# Altium schematic sheet Touch_Screen_Cont.SchDoc
size A4
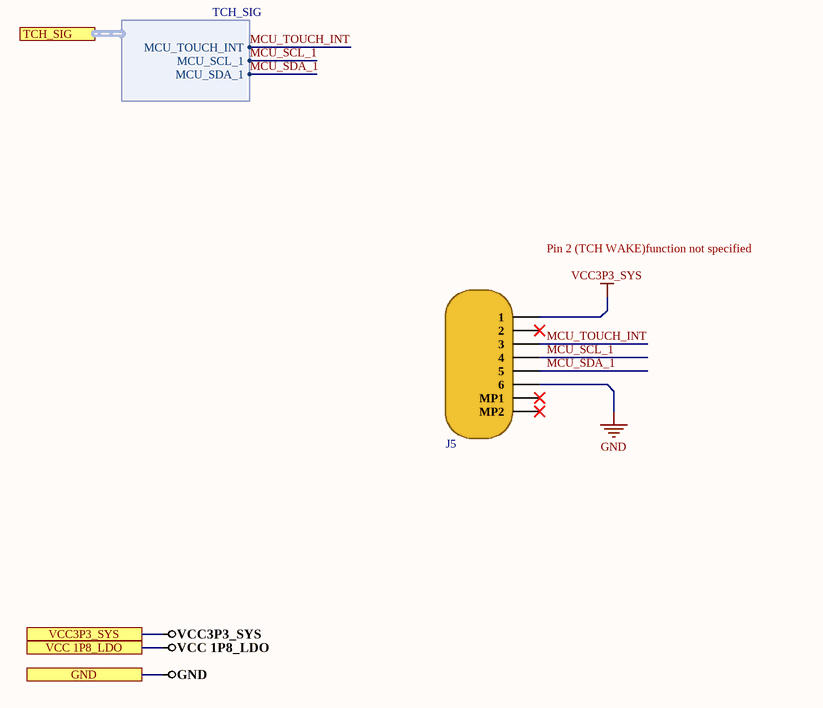
[diagram p0: Touch_Screen_Cont.SchDoc]

## Parts
J5  68710614022  [68710614022]  (value not drawn)

## Ports
GND, TCH_SIG (harness TCH_SIG), VCC3P3_SYS, VCC 1P8_LDO

## Harnesses
TCH_SIG: MCU_TOUCH_INT, MCU_SCL_1, MCU_SDA_1

## Nets
GND: J5.6 ; port GND
VCC3P3_SYS: J5.1 ; port VCC3P3_SYS
VCC 1P8_LDO: port VCC 1P8_LDO
MCU_SCL_1: J5.4 ; port TCH_SIG.MCU_SCL_1
MCU_SDA_1: J5.5 ; port TCH_SIG.MCU_SDA_1
MCU_TOUCH_INT: J5.3 ; port TCH_SIG.MCU_TOUCH_INT

Not connected (* = marked no-connect by the designer): J5 2* MP1* MP2*

## Notes on the sheet
- Pin 2 (TCH WAKE)function not specified

## Library data of the parts
J5 = 68710614022: CONN FPC TOP 6POS 0.50MM R/A; Manufacturer: Wurth Electronics; Actuator Material: Polymer,Liquid Crystal Polymer; Current Rating: 500mA; Voltage Rating: 50V; Number of Positions: 6; Insulation Resistance: 100MR; Gender: Male; Pitch: 0.5mm; Supplier 1: Digi-Key; Manufacturer Part Number: 68710614022; RoHS: Yes; Category: FFC / FPC; Stock 1: 3457; Pricing 1: 1=0.92000, 10=0.88700, 50=0.82600, 100=0.76500, 500=0.70300, 1000=0.64200 (USD); Mount: Surface Mount; Contact Plating: Tin; Contact Material: Bronze,Tin; Housing Material: Liquid Crystal Polymer; Min Operating Temperature: -25°C; Max Operating Temperature: 85°C; Number of Rows: 1; Package Quantity: 1; Packaging: Tape and Reel; Termination: SMD/SMT; Contact Location: Top; Number of Contacts: 6; Orientation: Straight; Length: 9.5mm; Width: 2.1mm; REACH SVHC: Unknown; Flammability Rating: UL94 V-0; ComponentLink1URL: https://datasheet.ciiva.com/25617/0900766b81113bff-25617823.pdf?src-supplier=RSComponents; ComponentLink1Description: https://datasheet.ciiva.com/25617/0900766b81113bff-25617823.pdf?src-supplier=RSComponents; ComponentLink2URL: https://datasheet.ciiva.com/14153/6871xx14022-eng-datasheet-14153909.pdf?src-supplier=Distrelec; ComponentLink2Description: https://datasheet.ciiva.com/14153/6871xx14022-eng-datasheet-14153909.pdf?src-supplier=Distrelec; ComponentLink3URL: https://datasheet.ciiva.com/670/6871xx14022-670520.pdf?src-supplier=Digi-Key; ComponentLink3Description: https://datasheet.ciiva.com/670/6871xx14022-670520.pdf?src-supplier=Digi-Key; ComponentLink4URL: https://datasheet.ciiva.com/670/6871xx14022-670521.pdf?src-supplier=Digi-Key; ComponentLink4Description: https://datasheet.ciiva.com/670/6871xx14022-670521.pdf?src-supplier=Digi-Key; ComponentLink5URL: https://datasheet.ciiva.com/670/6871xx14022-670522.pdf?src-supplier=Digi-Key; ComponentLink5Description: https://datasheet.ciiva.com/670/6871xx14022-670522.pdf?src-supplier=Digi-Key; ComponentLink6URL: https://datasheet.ciiva.com/7662/6871xx14022-7662618.pdf?src-supplier=Element14; ComponentLink6Description: https://datasheet.ciiva.com/7662/6871xx14022-7662618.pdf?src-supplier=Element14; ComponentLink7URL: https://datasheet.ciiva.com/29318/709078-da-01-en-smd-zif-stecker-90grad-kontakte-oben-6-p-29318038.pdf?src-supplier=Conrad; ComponentLink7Description: https://datasheet.ciiva.com/29318/709078-da-01-en-smd-zif-stecker-90grad-kontakte-oben-6-p-29318038.pdf?src-supplier=Conrad; Supplier Part Number 1: 732-2018-1-ND